# Altium schematic sheet USIM_Sec.SchDoc
size A4; DocumentNumber: 12; SheetNumber: 12; SheetTotal: 28
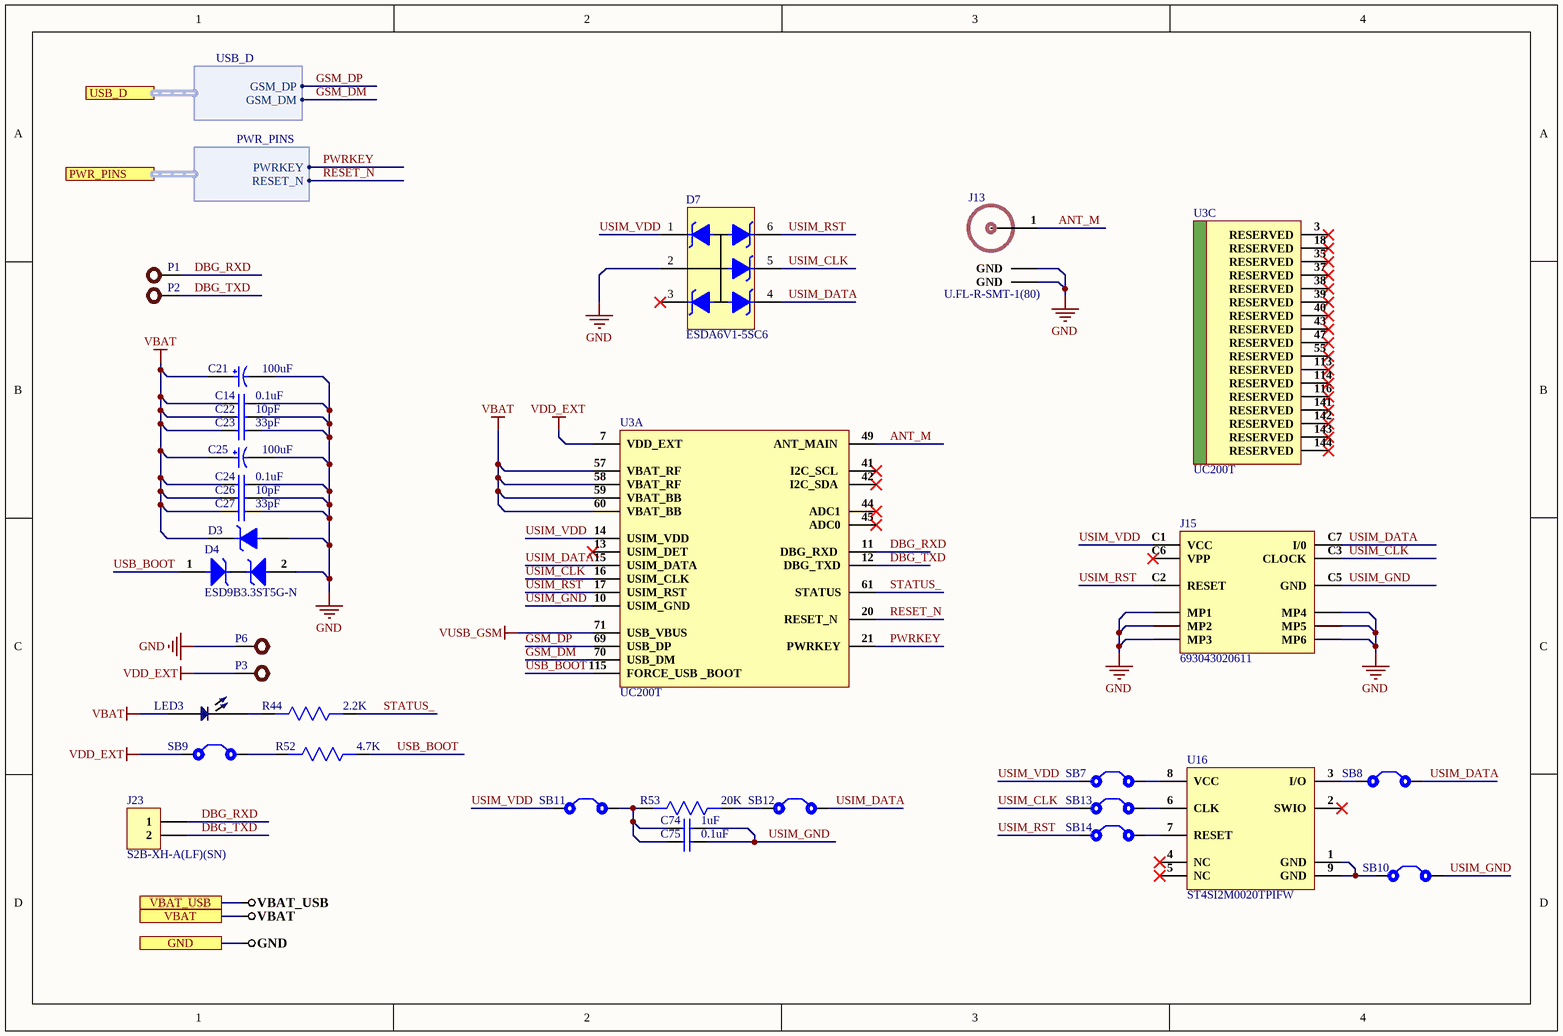
[diagram p0: USIM_Sec.SchDoc]

## Parts
C14  0.1uF  [Cap0603]
C21  100uF  [593D107X9016D2TE3]
C22  10pF  [Cap0603]
C23  33pF  [Cap0603]
C24  0.1uF  [Cap0603]
C25  100uF  [593D107X9016D2TE3]
C26  10pF  [Cap0603]
C27  33pF  [Cap0603]
C74  1uF  [Cap0603]
C75  0.1uF  [CAP 0201]
D3  BZD27C5V1P_R1_00001  [BZD27C5V1P_R1_00001]  (value not drawn)
D4  ESD9B3.3ST5G-N  [ESD9B3.3ST5G-N]
D7  ESDA6V1-5SC6  [SOT-23-6]
J13  U.FL-R-SMT-1(80)  [U.FL-R-SMT-1(80)]
J15  693043020611  [693043020611]
J23  S2B-XH-A(LF)(SN)  [S2B-XH-A(LF)(SN)]
LED3  LED Blue  [LED 0402]  (value not drawn)
P1  Test Point  [TEST POINT]  (value not drawn)
P2  Test Point  [TEST POINT]  (value not drawn)
P3  Test Point  [TEST POINT]  (value not drawn)
P6  Test Point  [TEST POINT]  (value not drawn)
R44  2.2K  [Res0603]
R52  4.7K  [Res0603]
R53  20K  [Res0603]
SB7  Solder Bridge  [Solder Bridge]  (value not drawn)
SB8  Solder Bridge  [Solder Bridge]  (value not drawn)
SB9  Solder Bridge  [Solder Bridge]  (value not drawn)
SB10  Solder Bridge  [Solder Bridge]  (value not drawn)
SB11  Solder Bridge  [Solder Bridge]  (value not drawn)
SB12  Solder Bridge  [Solder Bridge]  (value not drawn)
SB13  Solder Bridge  [Solder Bridge]  (value not drawn)
SB14  Solder Bridge  [Solder Bridge]  (value not drawn)
U3  UC200T  [UC200T]  (parts A,C of 4)
U16  ST4SI2M0020TPIFW  [ST4SI2M0020TPIFW]

## Ports
GND, PWR_PINS (harness PWR_PINS), USB_D (harness USB_D), VBAT, VBAT_USB

## Harnesses
USB_D: GSM_DP, GSM_DM
PWR_PINS: PWRKEY, RESET_N

## Nets
GND: C14.2 C21.2 C22.2 C23.2 C24.2 C25.2 C26.2 C27.2 D3.1(ANODE) D4.2 D7.2(GND) J13.2(GND) J13.3(GND) J15.MP1 J15.MP2 J15.MP3 J15.MP4 J15.MP5 J15.MP6 P6.1 ; port GND
VBAT: C14.1 C21.1 C22.1 C23.1 C24.1 C25.1 C26.1 C27.1 D3.2(CATHODE) LED3.1 U3.57(VBAT_RF) U3.58(VBAT_RF) U3.59(VBAT_BB) U3.60(VBAT_BB) ; port VBAT
VBAT_USB: port VBAT_USB
VDD_EXT: P3.1 SB9.1 U3.7(VDD_EXT)
VUSB_GSM: U3.71(USB_VBUS)
ANT_M: J13.1(RF_IN) U3.49(ANT_MAIN)
DBG_RXD: J23.1 P1.1 U3.11(DBG_RXD)
DBG_TXD: J23.2 P2.1 U3.12(DBG_TXD)
GSM_DM: U3.70(USB_DM) ; port USB_D.GSM_DM
GSM_DP: U3.69(USB_DP) ; port USB_D.GSM_DP
PWRKEY: U3.21(PWRKEY) ; port PWR_PINS.PWRKEY
RESET_N: U3.20(RESET_N) ; port PWR_PINS.RESET_N
STATUS_: R44.1 U3.61(STATUS)
USB_BOOT: D4.1 R52.1 U3.115(FORCE_USB__BOOT)
USIM_CLK: D7.5(I/O4) J15.C3(CLOCK) SB13.1 U3.16(USIM_CLK)
USIM_DATA: D7.4(I/O3) J15.C7(I/0) SB8.2 SB12.2 U3.15(USIM_DATA)
USIM_GND: C74.2 C75.2 J15.C5(GND) SB10.2 U3.10(USIM_GND)
USIM_RST: D7.6(I/O5) J15.C2(RESET) SB14.1 U3.17(USIM_RST)
USIM_VDD: D7.1(I/O1) J15.C1(VCC) SB7.1 SB11.1 U3.14(USIM_VDD)
NetC74_1: C74.1 C75.1 R53.2 SB11.2
NetLED3_2: LED3.2 R44.2
NetR52_2: R52.2 SB9.2
NetR53_1: R53.1 SB12.1
NetSB7_2: SB7.2 U16.8(VCC)
NetSB8_1: SB8.1 U16.3(I/O)
NetSB10_1: SB10.1 U16.1(GND) U16.9(GND)
NetSB13_2: SB13.2 U16.6(CLK)
NetSB14_2: SB14.2 U16.7(RESET)

Not connected (* = marked no-connect by the designer): D7 3(I/O2)*; J15 C6(VPP)*; U3 3(RESERVED)* 13(USIM_DET_)* 18(RESERVED)* 35(RESERVED)* 37(RESERVED)* 38(RESERVED)* 39(RESERVED)* 40(RESERVED)* 41(I2C_SCL_)* 42(I2C_SDA_)* 43(RESERVED)* 44(ADC1)* 45(ADC0)* 47(RESERVED)* 55(RESERVED)* 113(RESERVED)* 114(RESERVED)* 116(RESERVED)* 141(RESERVED)* 142(RESERVED)* 143(RESERVED)* 144(RESERVED)*; U16 2(SWIO)* 4(NC)* 5(NC)*

## Library data of the parts
C14 C24 = CC0603ZRY5V9BB104: CAP CER 0.1UF 50V Y5V 0603; Manufacturer: Yageo; Capacitance: 100nF; Tolerance: 80%; Supplier 1: Digi-Key; Manufacturer Part Number: CC0603ZRY5V9BB104; Stock 1: 15000880; Pricing 1: 1=0.1, 10=0.075, 100=0.0334, 500=0.02386, 1000=0.01874 (USD); Mount: Surface Mount; Case/Package: 0603; Number of Pins: 2; Case Code (Metric): 1608; Case Code (Imperial): 0603; Min Operating Temperature: -30°C; Max Operating Temperature: 85°C; Dielectric: Y5V; Voltage Rating: 50V; Package Quantity: 1; Packaging: Tape and Reel; Voltage Rating (DC): 50V; Termination: SMD/SMT; Composition: Ceramic; Voltage: 50V; Length: 1.6mm; Height: 0.8mm; Width: 0.031inch; Thickness: 0.035inch; Depth: 0.8mm; Radiation Hardening: No; REACH SVHC: No SVHC; Lead Free: Lead Free; Halogen Free: Halogen Free; ComponentLink1URL: http://www.yageo.com/documents/recent/UPY-GPHC_Y5V_6.3V-to-50V_8.pdf?src-supplier=Digi-Key; ComponentLink1Description: http://www.yageo.com/documents/recent/UPY-GPHC_Y5V_6.3V-to-50V_8.pdf?src-supplier=Digi-Key; ComponentLink2URL: http://www.yageo.com/documents/recent/UPY-GPHC_Y5V_6.3V-to-50V_5.pdf?src-supplier=Avnet+Europe; ComponentLink2Description: http://www.yageo.com/documents/recent/UPY-GPHC_Y5V_6.3V-to-50V_5.pdf?src-supplier=Avnet+Europe; ComponentLink3URL: https://www.verical.com/server-webapp/html/getDatasheet?partID=403611&src-supplier=Verical; ComponentLink3Description: https://www.verical.com/server-webapp/html/getDatasheet?partID=403611&src-supplier=Verical; ComponentLink4URL: http://www.mouser.com/ds/2/447/Yageo_UPY-GP_NP0_16V-to-50V_9-358835.pdf?src-supplier=Mouser; ComponentLink4Description: http://www.mouser.com/ds/2/447/Yageo_UPY-GP_NP0_16V-to-50V_9-358835.pdf?src-supplier=Mouser; ComponentLink5URL: http://www.farnell.com/datasheets/1132289.pdf?src-supplier=Element14; ComponentLink5Description: http://www.farnell.com/datasheets/1132289.pdf?src-supplier=Element14; Supplier Part Number 1: 311-1343-1-ND
C21 C25 = 593D107X9016D2TE3: CAP TANT 100UF 10% 16V 2917; Manufacturer: Vishay Sprague; Tolerance: 20%; ESR (Equivalent Series Resistance): 125mR; Ripple Current: 1.1mA; Leakage Current: 16uA; Polarity: Polar; Dissipation Factor: 8%; Supplier 1: Digi-Key; Manufacturer Part Number: 593D107X9016D2TE3; Stock 1: 7834; Pricing 1: 1=0.99, 10=0.783, 100=0.5874 (USD); Mount: Surface Mount,PCB; Case/Package: 2917; Number of Pins: 2; Weight: 0.023634oz; Case Code (Metric): 7343; Case Code (Imperial): 2917; Min Operating Temperature: -55°C; Max Operating Temperature: 125°C; Capacitance: 100uF; Packaging: Tape and Reel; Voltage Rating: 16V; Package Quantity: 1; Voltage Rating (DC): 16V; Termination: SMD/SMT; Voltage: 16V; Features: General Purpose; Length: 7.3mm; Height: 2.8mm; Depth: 4.3mm; Width: 0.169inch; Height - Seated (Max): 0.122inch; Radiation Hardening: No; REACH SVHC: Unknown; Lead Free: Lead Free; ComponentLink1URL: http://www.vishay.com/docs/40005/593d.pdf?src-supplier=Avnet; ComponentLink1Description: http://www.vishay.com/docs/40005/593d.pdf?src-supplier=Avnet; ComponentLink2URL: http://documents.rs-components.com/techlib://itc_doclist_GB.htm?stockno=6844477&src-supplier=RSComponents; ComponentLink2Description: http://documents.rs-components.com/techlib://itc_doclist_GB.htm?stockno=6844477&src-supplier=RSComponents; ComponentLink3URL: http://www.vishay.com/docs/40005/593d.pdf?src-supplier=Avnet+Europe; ComponentLink3Description: http://www.vishay.com/docs/40005/593d.pdf?src-supplier=Avnet+Europe; ComponentLink4URL: http://www.vishay.com/docs/40005/593d.pdf?src-supplier=Digi-Key; ComponentLink4Description: http://www.vishay.com/docs/40005/593d.pdf?src-supplier=Digi-Key; ComponentLink5URL: http://www.mouser.com/ds/2/427/593d-239975.pdf?src-supplier=Mouser; ComponentLink5Description: http://www.mouser.com/ds/2/427/593d-239975.pdf?src-supplier=Mouser; ComponentLink6URL: https://www.alliedelec.com/m/d/4999163682384315a74ef22064734d6b.pdf?src-supplier=Allied+Electronics; ComponentLink6Description: https://www.alliedelec.com/m/d/4999163682384315a74ef22064734d6b.pdf?src-supplier=Allied+Electronics; Supplier Part Number 1: 718-1102-1-ND
C22 C26 = 06035A100JAT2A: CAP CER 10PF 50V C0G/NP0 0603; Manufacturer: Kyocera AVX; Manufacturer Part Number: 06035A100JAT2A/4K; Tolerance: 5%; Dielectric: C0G; Temperature Coefficient: 30ppm/°C; Insulation Resistance: 100GR; Supplier 1: Digi-Key; Stock 1: 196463; Pricing 1: 1=0.1, 10=0.05, 50=0.0272, 100=0.0222, 500=0.01586, 1000=0.01246 (USD); Mount: Surface Mount; Case/Package: 0603; Number of Pins: 2; Min Operating Temperature: -55°C; Max Operating Temperature: 125°C; Capacitance: 10pF; Packaging: Cut Tape; Voltage Rating (DC): 50V; Voltage: 50V; Length: 1.6mm; Width: 810um; Height: 0.9mm; Depth: 0.81mm; Thickness: 864um; REACH SVHC: No SVHC; Lead Free: Lead Free; Supplier Part Number 1: 478-1163-1-ND
C23 C27 = CC0603JRNPO9BN330: CAP CER 33PF 50V C0G/NPO 0603; Manufacturer: Yageo; Dielectric Material: Ceramic; Tolerance: 5%; Dielectric: C0G; Temperature Coefficient: 30ppm/°C; Insulation Resistance: 100GR; Supplier 1: Digi-Key; Manufacturer Part Number: CC0603JRNPO9BN330; Stock 1: 490595; Pricing 1: 1=0.1, 10=0.045, 100=0.0199, 500=0.01424, 1000=0.01119 (USD); Mount: Surface Mount; Case/Package: 0603; Number of Pins: 2; Case Code (Metric): 1608; Case Code (Imperial): 0603; Min Operating Temperature: -55°C; Max Operating Temperature: 125°C; Capacitance: 33pF; Packaging: Tape and Reel; Voltage Rating: 50V; Package Quantity: 1; Voltage Rating (DC): 50V; Termination: SMD/SMT; Composition: Ceramic; Voltage: 50V; Length: 1.6mm; Height: 0.8mm; Width: 0.031inch; Thickness: 0.035inch; Depth: 0.8mm; Radiation Hardening: No; REACH SVHC: No SVHC; Lead Free: Lead Free; ComponentLink1URL: http://www.yageo.com/documents/recent/UPY-GP_NP0_16V-to-50V_16.pdf?src-supplier=Digi-Key; ComponentLink1Description: http://www.yageo.com/documents/recent/UPY-GP_NP0_16V-to-50V_16.pdf?src-supplier=Digi-Key; ComponentLink2URL: http://www.mouser.com/ds/2/447/Yageo_UPY-GP_NP0_16V-to-50V_9-358835.pdf?src-supplier=Mouser; ComponentLink2Description: http://www.mouser.com/ds/2/447/Yageo_UPY-GP_NP0_16V-to-50V_9-358835.pdf?src-supplier=Mouser; ComponentLink3URL: http://www.farnell.com/datasheets/2213336.pdf?src-supplier=Element14; ComponentLink3Description: http://www.farnell.com/datasheets/2213336.pdf?src-supplier=Element14; ComponentLink4URL: http://www.farnell.com/datasheets/1443161.pdf?src-supplier=Element14; ComponentLink4Description: http://www.farnell.com/datasheets/1443161.pdf?src-supplier=Element14; ComponentLink5URL: http://www.yageo.com/documents/recent/UPY-GP_NP0_16V-to-50V_8.pdf?src-supplier=Avnet; ComponentLink5Description: http://www.yageo.com/documents/recent/UPY-GP_NP0_16V-to-50V_8.pdf?src-supplier=Avnet; ComponentLink6URL: https://www.verical.com/server-webapp/html/getDatasheet?partID=403532&src-supplier=Verical; ComponentLink6Description: https://www.verical.com/server-webapp/html/getDatasheet?partID=403532&src-supplier=Verical; Supplier Part Number 1: 311-1064-1-ND
C74 = CC0603KRX5R8BB105: CAP CER 1UF 25V X5R 0603; Manufacturer: Yageo; Tolerance: 10%; Supplier 1: Digi-Key; Manufacturer Part Number: CC0603KRX5R8BB105; Stock 1: 459947; Pricing 1: 1=0.1, 10=0.076, 100=0.0337, 500=0.0241, 1000=0.01894 (USD); Mount: Surface Mount; Case/Package: 0603; Number of Pins: 2; Case Code (Metric): 1608; Case Code (Imperial): 0603; Min Operating Temperature: -55°C; Max Operating Temperature: 85°C; Capacitance: 1uF; Dielectric: X5R; Package Quantity: 1; Voltage Rating: 25V; Packaging: Tape and Reel; Termination: SMD/SMT; Voltage Rating (DC): 25V; Length: 1.6mm; Height: 0.8mm; Width: 0.031inch; Thickness: 0.035inch; Depth: 0.8mm; Radiation Hardening: No; REACH SVHC: No SVHC; Lead Free: Lead Free; Halogen Free: Halogen Free; ComponentLink1URL: http://www.yageo.com/documents/recent/UPY-GPHC_X5R_4V-to-50V_25.pdf?src-supplier=Digi-Key; ComponentLink1Description: http://www.yageo.com/documents/recent/UPY-GPHC_X5R_4V-to-50V_25.pdf?src-supplier=Digi-Key; ComponentLink2URL: http://www.yageo.com/documents/recent/UPY-GPHC_X5R_4V-to-50V_12.pdf?src-supplier=Avnet+Europe; ComponentLink2Description: http://www.yageo.com/documents/recent/UPY-GPHC_X5R_4V-to-50V_12.pdf?src-supplier=Avnet+Europe; ComponentLink3URL: http://www.farnell.com/datasheets/1525783.pdf?src-supplier=Element14; ComponentLink3Description: http://www.farnell.com/datasheets/1525783.pdf?src-supplier=Element14; ComponentLink4URL: http://www.yageo.com/documents/recent/UPY-GPHC_X5R_4V-to-50V_12.pdf?src-supplier=Avnet; ComponentLink4Description: http://www.yageo.com/documents/recent/UPY-GPHC_X5R_4V-to-50V_12.pdf?src-supplier=Avnet; Supplier Part Number 1: 311-1445-1-ND
C75 = GRM033C81E104KE14D: CAP CER 0.1UF 25V X6S 0201; Manufacturer: Murata; Capacitance: 100nF; Tolerance: 10%; Supplier 1: Digi-Key; Manufacturer Part Number: GRM033C81E104KE14D; RoHS: Yes; Category: Ceramic Capacitors; Stock 1: 91; Pricing 1: 1=0.10000, 10=0.05100, 50=0.02780, 100=0.02260, 500=0.01616, 1000=0.01270, 2500=0.01155, 5000=0.01063 (USD); Mount: Surface Mount; Case/Package: 0201; Case Code (Metric): 0603; Case Code (Imperial): 0201; Weight: 1.2E-05oz; Min Operating Temperature: -55°C; Max Operating Temperature: 105°C; Packaging: Tape and Reel; Voltage Rating: 25V; Dielectric: X6S; Termination: SMD/SMT; Voltage Rating (DC): 25V; Package Quantity: 15000; Length: 0.024inch; Width: 0.3mm; Height: 0.3mm; Thickness: 0.013inch; RoHS Compliant: Yes; ComponentLink1URL: http://www.mouser.com/ds/2/281/c02e-2905.pdf?src-supplier=Mouser; ComponentLink1Description: http://www.mouser.com/ds/2/281/c02e-2905.pdf?src-supplier=Mouser; ComponentLink2URL: http://www.farnell.com/datasheets/2722733.pdf?src-supplier=Farnell; ComponentLink2Description: http://www.farnell.com/datasheets/2722733.pdf?src-supplier=Farnell; ComponentLink3URL: http://search.murata.co.jp/Ceramy/image/img/A01X/G101/ENG/GRM033C81E104KE14-01.pdf?src-supplier=Digi-Key; ComponentLink3Description: http://search.murata.co.jp/Ceramy/image/img/A01X/G101/ENG/GRM033C81E104KE14-01.pdf?src-supplier=Digi-Key; Supplier Part Number 1: 490-10403-1-ND
D3 = BZD27C5V1P_R1_00001: 5.1V 800mW 5uA @ 1V SOD-123FL Zener Diodes RoHS; Manufacturer: PANJIT International; Value: Custom; Manufacturer Part No: BZD27C5V1P_R1_00001; Package: SOD-123FL
D4 = ESD9B3.3ST5G-N: Bidirectional 3.3V (Max) 3.8V 8V 10A (8/20us) SMD TVS RoHS; Manufacturer: Bourne Semicon (Shenzhen); ComponentLink1URL: https://www.mouser.com/ds/2/302/PESD3V3X1BL-64229.pdf?src-supplier=Mouser; ComponentLink1Description: https://www.mouser.com/ds/2/302/PESD3V3X1BL-64229.pdf?src-supplier=Mouser; ComponentLink2URL: https://assets.nexperia.com/documents/data-sheet/PESD3V3X1BL.pdf?src-supplier=Digi-Key; ComponentLink2Description: https://assets.nexperia.com/documents/data-sheet/PESD3V3X1BL.pdf?src-supplier=Digi-Key; ComponentLink3URL: http://www.onsemi.cn/pub_link/Collateral/ESD9B-D.PDF?src-supplier=Digi-Key; ComponentLink3Description: http://www.onsemi.cn/pub_link/Collateral/ESD9B-D.PDF?src-supplier=Digi-Key; ComponentLink4URL: http://www.onsemi.com/pub/Collateral/ESD9B-D.PDF?src-supplier=Avnet+Europe; ComponentLink4Description: http://www.onsemi.com/pub/Collateral/ESD9B-D.PDF?src-supplier=Avnet+Europe; ComponentLink5URL: http://www.mouser.com/ds/2/308/ESD9B-D-479788.pdf?src-supplier=Mouser; ComponentLink5Description: http://www.mouser.com/ds/2/308/ESD9B-D-479788.pdf?src-supplier=Mouser; ComponentLink6URL: http://www.farnell.com/datasheets/1596367.pdf?src-supplier=Element14; ComponentLink6Description: http://www.farnell.com/datasheets/1596367.pdf?src-supplier=Element14; ComponentLink7URL: https://www.verical.com/server-webapp/html/getDatasheet?partID=292713&src-supplier=Verical; ComponentLink7Description: https://www.verical.com/server-webapp/html/getDatasheet?partID=292713&src-supplier=Verical; ComponentLink8URL: http://www.onsemi.com/pub/Collateral/ESD9B-D.PDF?src-supplier=Avnet; ComponentLink8Description: http://www.onsemi.com/pub/Collateral/ESD9B-D.PDF?src-supplier=Avnet; Manufacturer Part No: ESD9B3.3ST5G-N; Package: DFN1006; Value: 3.3V
D7 = ESDA6V1-5SC6: TVS DIODE 3V SOT23-6; Manufacturer: STMicroelectronics; Direction: Unidirectional; Min Breakdown Voltage: 6.1V; Clamping Voltage: 11.35V; Peak Pulse Current: 15A; Number of Elements: 5; Capacitance: 50pF; Element Configuration: Common Anode; Peak Pulse Power: 100W; Power Line Protection: No; Max Reverse Leakage Current: 1uA; Test Current: 1mA; Max Breakdown Voltage: 7.2V; ESD Protection: Yes; Diode Type: ZENER; Supplier 1: Digi-Key; Manufacturer Part Number: ESDA6V1-5SC6; RoHS: Yes; Category: TVS Diodes; Stock 1: 10768; Pricing 1: 1=0.46000, 10=0.39400, 100=0.27370, 500=0.21368, 1000=0.17378 (USD); Mount: Surface Mount; Case/Package: SOT-23; Number of Pins: 6; Min Operating Temperature: -40°C; Max Operating Temperature: 125°C; Packaging: Tape and Reel; Reverse Standoff Voltage: 3V; Package Quantity: 1; Number of Channels: 5; Operating Supply Voltage: 3V; Number of Unidirectional Channels: 5; Polarity: Unidirectional; Breakdown Voltage: 6.1V; Termination: SMD/SMT; Working Voltage: 3V; Resistor Type: Zener; Series: ESDA, TRANSIL™; Reverse Breakdown Voltage: 6.1V; Max Power Dissipation: 100W; Leakage Current: 1uA; Voltage Rating (DC): 6.1V; Length: 3.05mm; Width: 1.75mm; Height: 1.3mm; Depth: 1.75mm; Radiation Hardening: No; RoHS Compliant: Yes; REACH SVHC: No SVHC; Lead Free: Lead Free; ComponentLink1URL: https://datasheet.ciiva.com/5782/453742-5782854.pdf?src-supplier=Farnell; ComponentLink1Description: https://datasheet.ciiva.com/5782/453742-5782854.pdf?src-supplier=Farnell; ComponentLink2URL: https://datasheet.ciiva.com/15143/getdatasheetpartid-146092-15143750.pdf?src-supplier=Verical; ComponentLink2Description: https://datasheet.ciiva.com/15143/getdatasheetpartid-146092-15143750.pdf?src-supplier=Verical; ComponentLink3URL: https://datasheet.ciiva.com/16210/cd00005102-16210854.pdf?src-supplier=Future+Electronics; ComponentLink3Description: https://datasheet.ciiva.com/16210/cd00005102-16210854.pdf?src-supplier=Future+Electronics; ComponentLink4URL: https://datasheet.ciiva.com/14161/esda6v1l-st-eng-tds-14161530.pdf?src-supplier=Distrelec; ComponentLink4Description: https://datasheet.ciiva.com/14161/esda6v1l-st-eng-tds-14161530.pdf?src-supplier=Distrelec; ComponentLink5URL: https://datasheet.ciiva.com/4507/cd00005102-58005-4507934.pdf?src-supplier=Mouser; ComponentLink5Description: https://datasheet.ciiva.com/4507/cd00005102-58005-4507934.pdf?src-supplier=Mouser; ComponentLink6URL: https://datasheet.ciiva.com/338/cd00005102-338720.pdf?src-supplier=Digi-Key; ComponentLink6Description: https://datasheet.ciiva.com/338/cd00005102-338720.pdf?src-supplier=Digi-Key; ComponentLink7URL: https://datasheet.ciiva.com/22695/453742-22695670.pdf?src-supplier=Element14; ComponentLink7Description: https://datasheet.ciiva.com/22695/453742-22695670.pdf?src-supplier=Element14; ComponentLink8URL: https://datasheet.ciiva.com/7662/453742-7662123.pdf?src-supplier=Element14; ComponentLink8Description: https://datasheet.ciiva.com/7662/453742-7662123.pdf?src-supplier=Element14; ComponentLink9URL: https://datasheet.ciiva.com/1276/453742-1276863.pdf?src-supplier=Element14; ComponentLink9Description: https://datasheet.ciiva.com/1276/453742-1276863.pdf?src-supplier=Element14; ComponentLink10URL: https://datasheet.ciiva.com/41443/001184254-da-01-en-transil-array-esda6v1-5sc6-sot-23-6-stm-41443467.pdf?src-supplier=Conrad; ComponentLink10Description: https://datasheet.ciiva.com/41443/001184254-da-01-en-transil-array-esda6v1-5sc6-sot-23-6-stm-41443467.pdf?src-supplier=Conrad; Supplier Part Number 1: 497-7747-1-ND
J13 = U.FL-R-SMT-1(80): CONN U.FL RCPT STR 50 OHM SMD; Manufacturer: Hirose; Supplier 1: Future Electronics; Manufacturer Part Number: U.FL-R-SMT-1(80); Stock 1: 1272; Pricing 1: 1=1.07, 500=0.785, 1500=0.74, 2500=0.72, 5000=0.695 (USD); Case/Package: SMD/SMT; Package Quantity: 10000; Packaging: Tape and Reel; Lead Free: Lead Free; ComponentLink1URL: https://www.hirose.com/product/en/download_file/key_name/U.FL-R-SMT-1%2880%29/category/Specification%20Sheet/doc_file_id/37638/?file_category_id=9&item_id=03310472280&is_series=&src-supplier=Digi-Key; ComponentLink1Description: https://www.hirose.com/product/en/download_file/key_name/U.FL-R-SMT-1%2880%29/category/Specification%20Sheet/doc_file_id/37638/?file_category_id=9&item_id=03310472280&is_series=&src-supplier=Digi-Key; ComponentLink2URL: http://www.mouser.com/ds/2/185/U.FL_catalog-939761.pdf?src-supplier=Mouser; ComponentLink2Description: http://www.mouser.com/ds/2/185/U.FL_catalog-939761.pdf?src-supplier=Mouser; Supplier Part Number 1: U.FL-R-SMT-1(80)-CUTT
J15 = 693043020611: CONN SMART CARD PUSH-PULL; Manufacturer: Wurth Electronics; Number of Positions: 6; Connector Type: Connector; Supplier 1: Digi-Key; Manufacturer Part Number: 693043020611; Stock 1: 21915; Pricing 1: 1=1.69, 10=1.663, 50=1.54, 100=1.417, 500=1.232 (USD); Mount: Surface Mount; Number of Pins: 6; Contact Material: Copper Alloy; Contact Plating: Gold; Packaging: Tape and Reel; Number of Contacts: 6; Features: Shielded; REACH SVHC: Unknown; Lead Free: Lead Free; Supplier Part Number 1: 732-5954-1-ND
J23 = S2B-XH-A(LF)(SN): CONN HEADER R/A 2POS 2.5MM; Manufacturer: JST; Current Rating: 3A; Contact Resistance: 20mR; Voltage Rating (AC): 250V; Number of Positions: 2; Insulation Resistance: 1GR; Gender: Male; Connector Type: Male Pin; Wire/Cable Gauge: 22AWG; Supplier 1: Digi-Key; Manufacturer Part Number: S2B-XH-A(LF)(SN); RoHS: Yes; Category: Headers and Wire Housings; Stock 1: 44898; Pricing 1: 1=0.17000, 10=0.16200, 100=0.11260, 500=0.09524, 1000=0.07792, 5000=0.06927, 10000=0.06277 (USD); Mount: Through Hole; Contact Material: Brass; Contact Plating: Tin,Copper,Lead; Color: Natural; Housing Color: White; Housing Material: Polyamide; Min Operating Temperature: -25°C; Max Operating Temperature: 85°C; Number of Rows: 1; Voltage Rating: 250V; Termination: Press-Fit; Number of Contacts: 2; Max Current Rating: 3A; Package Quantity: 1000; Packaging: Bulk; Max Voltage Rating (AC): 250V; Max Voltage Rating (DC): 250V; Orientation: Right Angle; Length: 7.4mm; Pitch: 2.5mm; Lead Pitch: 2.5mm; Depth: 11.5mm; REACH SVHC: No SVHC; Lead Free: Lead Free; ComponentLink1URL: https://datasheet.ciiva.com/16208/s2b-xh-alfsn-16208978.pdf?src-supplier=Future+Electronics; ComponentLink1Description: https://datasheet.ciiva.com/16208/s2b-xh-alfsn-16208978.pdf?src-supplier=Future+Electronics; ComponentLink2URL: https://datasheet.ciiva.com/8052/1684882-8052211.pdf?src-supplier=Element14; ComponentLink2Description: https://datasheet.ciiva.com/8052/1684882-8052211.pdf?src-supplier=Element14; ComponentLink3URL: https://datasheet.ciiva.com/11746/0900766b8082f560-11746947.pdf?src-supplier=RSComponents; ComponentLink3Description: https://datasheet.ciiva.com/11746/0900766b8082f560-11746947.pdf?src-supplier=RSComponents; ComponentLink4URL: https://datasheet.ciiva.com/26894/getdatasheetpartid-640270-26894603.pdf?src-supplier=Verical; ComponentLink4Description: https://datasheet.ciiva.com/26894/getdatasheetpartid-640270-26894603.pdf?src-supplier=Verical; ComponentLink5URL: https://datasheet.ciiva.com/26924/getdatasheetpartid-645395-26924076.pdf?src-supplier=Verical; ComponentLink5Description: https://datasheet.ciiva.com/26924/getdatasheetpartid-645395-26924076.pdf?src-supplier=Verical; ComponentLink6URL: https://datasheet.ciiva.com/26894/getdatasheetpartid-441330-26894909.pdf?src-supplier=Verical; ComponentLink6Description: https://datasheet.ciiva.com/26894/getdatasheetpartid-441330-26894909.pdf?src-supplier=Verical; ComponentLink7URL: https://datasheet.ciiva.com/726/exh-726412.pdf?src-supplier=Digi-Key; ComponentLink7Description: https://datasheet.ciiva.com/726/exh-726412.pdf?src-supplier=Digi-Key; ComponentLink8URL: https://datasheet.ciiva.com/20207/523653-20207183.pdf?src-supplier=Rapid+Electronics; ComponentLink8Description: https://datasheet.ciiva.com/20207/523653-20207183.pdf?src-supplier=Rapid+Electronics; Supplier Part Number 1: 455-2257-ND
LED3 = APHHS1005QBC/D: LED BLUE CLEAR CHIP SMD 0402; Manufacturer: Kingbright; Lens Colour: Colorless; Forward Current: 20mA; Forward Voltage: 3.3V; Power Rating: 120mW; Luminous Intensity: 60mcd; Viewing Angle: 120°; Dominant Wavelength: 465nm; Supplier 1: Digi-Key; Manufacturer Part Number: APHHS1005QBC/D; Stock 1: 57149; Pricing 1: 1=0.58, 10=0.42, 25=0.3432, 100=0.2746, 250=0.23168, 500=0.19734, 1000=0.15444 (USD); Mount: Surface Mount; Case/Package: 0402; Colour: Blue; Case Code (Metric): 1005; Case Code (Imperial): 0402; Min Operating Temperature: -40°C; Max Operating Temperature: 85°C; Package Quantity: 2000; Illumination Colour: Blue; Packaging: Tape and Reel; Lens Style: Clear; Lens Transparency: Clear; Test Current: 20mA; Length: 1mm; Height: 0.6mm; Width: 0.5mm; Lead Free: Lead Free; ComponentLink1URL: http://www.mouser.com/ds/2/216/APHHS1005QBC-D-54846.pdf; ComponentLink1Description: http://www.mouser.com/ds/2/216/APHHS1005QBC-D-54846.pdf; ComponentLink2URL: http://www.kingbrightusa.com/images/catalog/SPEC/APHHS1005QBC-D.pdf; ComponentLink2Description: http://www.kingbrightusa.com/images/catalog/SPEC/APHHS1005QBC-D.pdf; Supplier Part Number 1: 754-1504-1-ND
P1-P3 P6 = TEST POINT: Test Point ON
R44 = RC0603FR-072K2L: RES SMD 2.2K OHM 1% 1/10W 0603; Manufacturer: Yageo Phycomp; Temperature Coefficient: 100ppm/°C; Resistance: 2.2kR; Power Rating: 100mW; Voltage Rating (DC): 50V; Supplier 1: Digi-Key; Manufacturer Part Number: RC0603FR-072K2L; Stock 1: 10587920; Pricing 1: 1=0.1, 10=0.023, 100=0.0094, 1000=0.00421, 2500=0.00366 (USD); Mount: Surface Mount; Case/Package: 0603; Number of Pins: 2; Min Operating Temperature: -55°C; Max Operating Temperature: 155°C; Tolerance: 1%; Packaging: Cut Tape; Length: 1.6mm; Height: 0.45mm; Width: 800um; Depth: 0.8mm; REACH SVHC: No SVHC; Lead Free: Lead Free; Supplier Part Number 1: 311-2.20KHRCT-ND
R52 = RC0603FR-074K7L: RES SMD 4.7K OHM 1% 1/10W 0603; Manufacturer: Yageo; Resistance: 4.7kR; Temperature Coefficient: 100ppm/°C; Power Rating: 100mW; Voltage Rating (DC): 50V; Supplier 1: Digi-Key; Manufacturer Part Number: RC0603FR-074K7L; Stock 1: 5337567; Pricing 1: 1=0.1, 10=0.023, 100=0.0094, 1000=0.00421, 2500=0.00366 (USD); Case/Package: 0603; Number of Pins: 2; Case Code (Imperial): 0603; Case Code (Metric): 1608; Min Operating Temperature: -55°C; Max Operating Temperature: 155°C; Tolerance: 1%; Composition: Thick Film; Packaging: Tape and Reel; Voltage Rating: 50V; Termination: SMD/SMT; Military Standard: Not; Length: 1.6mm; Height: 0.45mm; Width: 0.8mm; Depth: 0.8mm; Lead Pitch: 0.3mm; REACH SVHC: No SVHC; Lead Free: Lead Free; ComponentLink1URL: https://www.verical.com/server-webapp/html/getDatasheet?partID=422754&src-supplier=Verical; ComponentLink1Description: https://www.verical.com/server-webapp/html/getDatasheet?partID=422754&src-supplier=Verical; ComponentLink2URL: http://www.farnell.com/datasheets/2167052.pdf?src-supplier=Element14; ComponentLink2Description: http://www.farnell.com/datasheets/2167052.pdf?src-supplier=Element14; ComponentLink3URL: http://www.farnell.com/datasheets/38590.pdf?src-supplier=Element14; ComponentLink3Description: http://www.farnell.com/datasheets/38590.pdf?src-supplier=Element14; ComponentLink4URL: http://www.farnell.com/datasheets/1868787.pdf?src-supplier=Element14; ComponentLink4Description: http://www.farnell.com/datasheets/1868787.pdf?src-supplier=Element14; Supplier Part Number 1: 311-4.70KHRCT-ND
R53 = ESR03EZPF2002: RES SMD 20K OHM 1% 1/4W 0603; Manufacturer: Rohm; Resistance: 20kR; Max Power Dissipation: 250mW; Temperature Coefficient: 100ppm/°C; Supplier 1: Digi-Key; Manufacturer Part Number: ESR03EZPF2002; Stock 1: 4737; Pricing 1: 1=0.13, 10=0.12, 100=0.046, 1000=0.02024, 2500=0.01748 (USD); Case/Package: 0603; Case Code (Metric): 1608; Case Code (Imperial): 0603; Min Operating Temperature: -55°C; Max Operating Temperature: 155°C; Package Quantity: 1; Tolerance: 1%; Packaging: Tape and Reel; Resistor Type: Thick Film; Number of Terminations: 2; Features: Automotive AEC-Q200; Series: ESR; Length: 0.063inch; Width: 0.031inch; Height: 0.022inch; RoHS Compliant: Yes; ComponentLink1URL: https://www.rohm.com/datasheet/ESR01MZPF/esr-e?src-supplier=Digi-Key; ComponentLink1Description: https://www.rohm.com/datasheet/ESR01MZPF/esr-e?src-supplier=Digi-Key; Supplier Part Number 1: RHM20.0KADCT-ND
SB7-SB14 = Solder Bridge: Solder Bridge ON
U3 = UC200T: UMTS/HSPA+ Module; Manufacturer: Quectel; Value: Custom; Manufacturer Part No: UC200T; Package: Custom
U16 = ST4SI2M0020TPIFW: GSMA ESIM SYSTEM-ON-CHIP FOR SEC; Manufacturer: STMicroelectronics; Supplier 1: Digi-Key; Manufacturer Part Number: ST4SI2M0020TPIFW; RoHS: No; Category: Integrated Circuits (ICs); Stock 1: 10; Pricing 1: 1=5.72000, 10=5.14100, 25=4.86000, 100=4.21200, 250=3.99600, 500=3.58560 (USD); Supplier Part Number 1: 497-ST4SI2M0020TPIFWCT-ND